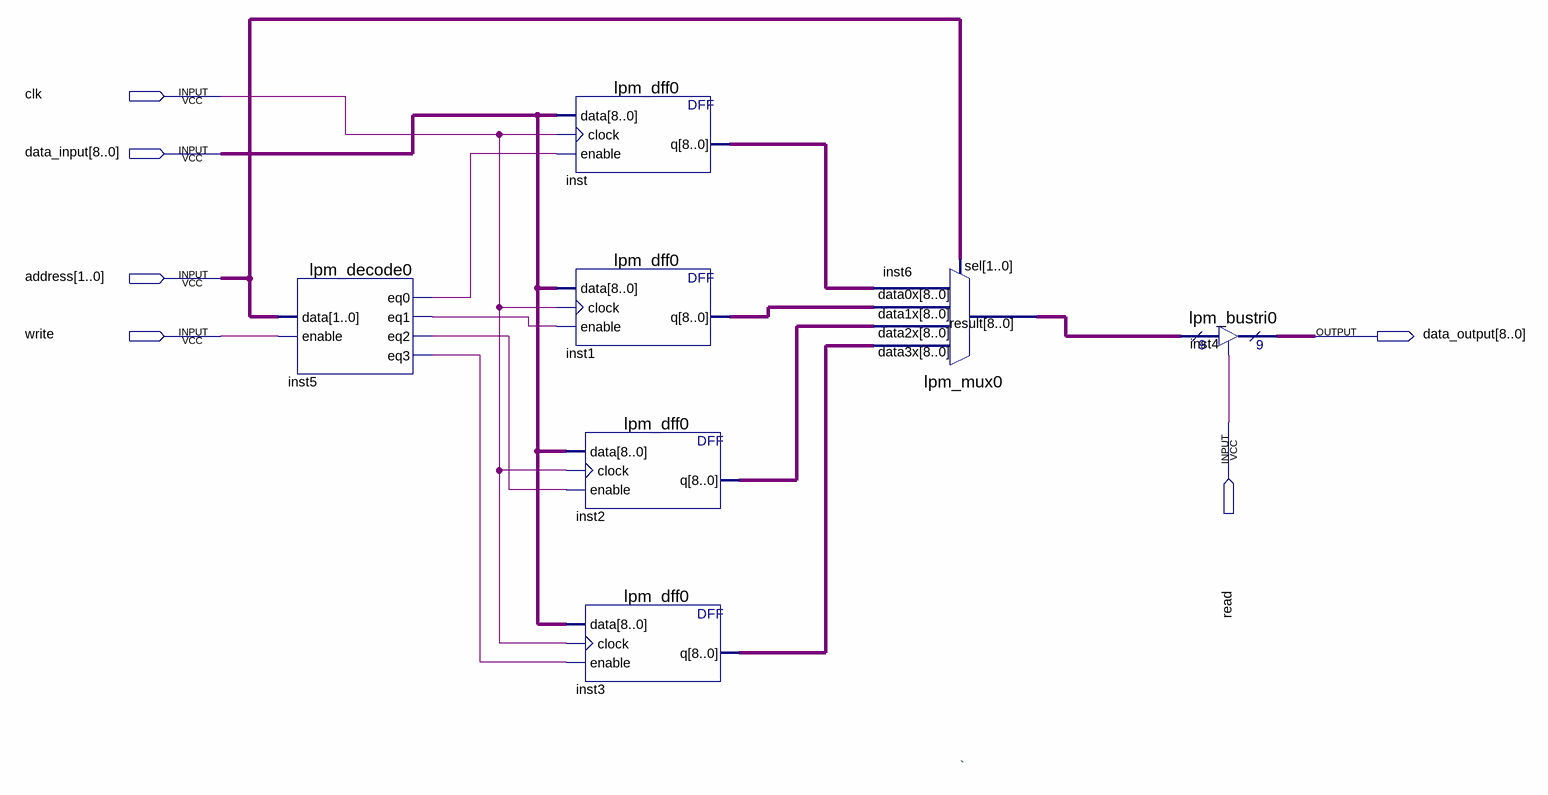
[diagram p0: schematic sheet]
// Quartus schematic ron.bdf as structural Verilog: 7 symbols, 6 pins
module ron (
  input  clk,
  input  [8:0] data_input,
  input  [1:0] address,
  input  write,
  input  read,
  output [8:0] data_output
);

  wire inst5_eq0, inst5_eq1, inst5_eq2, inst5_eq3;
  wire [8:0] inst1_q, inst2_q, inst3_q, inst6_result, inst_q;

  lpm_decode0 inst5 (
    .data(address), .enable(write), .eq0(inst5_eq0), .eq1(inst5_eq1), .eq2(inst5_eq2), .eq3(inst5_eq3));
  lpm_dff0 inst (.data(data_input), .clock(clk), .enable(inst5_eq0), .q(inst_q));
  lpm_dff0 inst1 (.data(data_input), .clock(clk), .enable(inst5_eq1), .q(inst1_q));
  lpm_dff0 inst2 (.data(data_input), .clock(clk), .enable(inst5_eq2), .q(inst2_q));
  lpm_dff0 inst3 (.data(data_input), .clock(clk), .enable(inst5_eq3), .q(inst3_q));
  lpm_mux0 inst6 (
    .data3x(inst3_q), .data2x(inst2_q), .data1x(inst1_q), .data0x(inst_q), .sel(address),
    .result(inst6_result));
  lpm_bustri0 inst4 (.enabledt(read), .data(inst6_result), .tridata(data_output));

  // Notes on the sheet:
  //   `
endmodule
